# Altium schematic sheet Peripheral Connections.SchDoc
size B; SheetNumber: 4; SheetTotal: 5
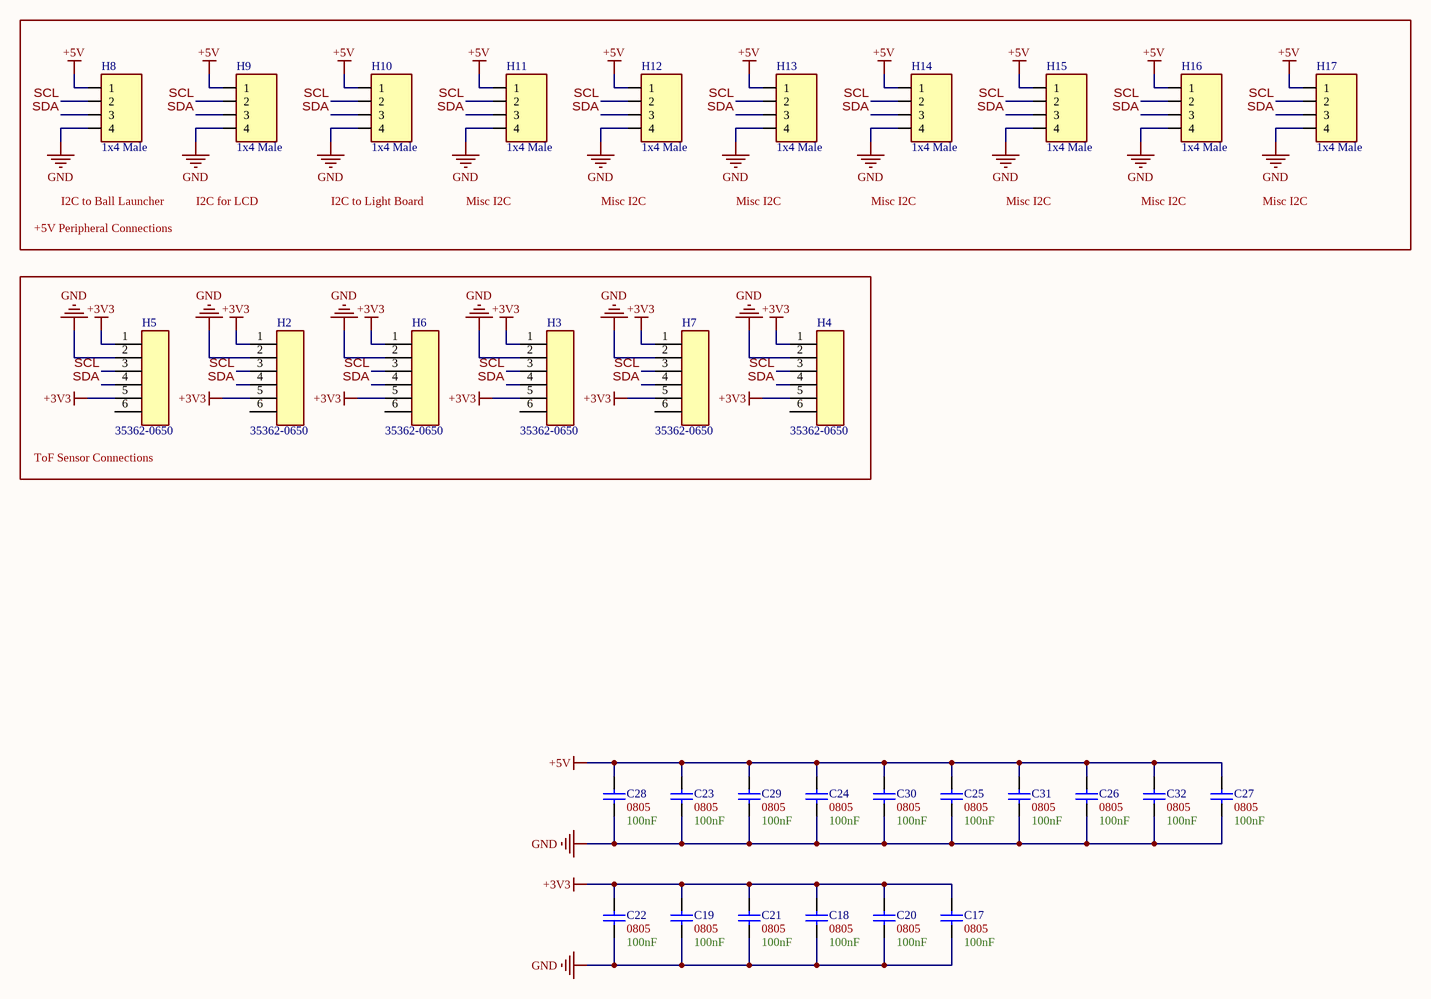
[diagram p0: Peripheral Connections.SchDoc]

## Parts
C17  Size Package: 0805  Capacitance: 100nF  [[Cap] SMD 0805]  (hidden comment: SMD Nonpolarized)
C18  Size Package: 0805  Capacitance: 100nF  [[Cap] SMD 0805]  (hidden comment: SMD Nonpolarized)
C19  Size Package: 0805  Capacitance: 100nF  [[Cap] SMD 0805]  (hidden comment: SMD Nonpolarized)
C20  Size Package: 0805  Capacitance: 100nF  [[Cap] SMD 0805]  (hidden comment: SMD Nonpolarized)
C21  Size Package: 0805  Capacitance: 100nF  [[Cap] SMD 0805]  (hidden comment: SMD Nonpolarized)
C22  Size Package: 0805  Capacitance: 100nF  [[Cap] SMD 0805]  (hidden comment: SMD Nonpolarized)
C23  Size Package: 0805  Capacitance: 100nF  [[Cap] SMD 0805]  (hidden comment: SMD Nonpolarized)
C24  Size Package: 0805  Capacitance: 100nF  [[Cap] SMD 0805]  (hidden comment: SMD Nonpolarized)
C25  Size Package: 0805  Capacitance: 100nF  [[Cap] SMD 0805]  (hidden comment: SMD Nonpolarized)
C26  Size Package: 0805  Capacitance: 100nF  [[Cap] SMD 0805]  (hidden comment: SMD Nonpolarized)
C27  Size Package: 0805  Capacitance: 100nF  [[Cap] SMD 0805]  (hidden comment: SMD Nonpolarized)
C28  Size Package: 0805  Capacitance: 100nF  [[Cap] SMD 0805]  (hidden comment: SMD Nonpolarized)
C29  Size Package: 0805  Capacitance: 100nF  [[Cap] SMD 0805]  (hidden comment: SMD Nonpolarized)
C30  Size Package: 0805  Capacitance: 100nF  [[Cap] SMD 0805]  (hidden comment: SMD Nonpolarized)
C31  Size Package: 0805  Capacitance: 100nF  [[Cap] SMD 0805]  (hidden comment: SMD Nonpolarized)
C32  Size Package: 0805  Capacitance: 100nF  [[Cap] SMD 0805]  (hidden comment: SMD Nonpolarized)
H2  35362-0650  [[Sherlock] 6pin]
H3  35362-0650  [[Sherlock] 6pin]
H4  35362-0650  [[Sherlock] 6pin]
H5  35362-0650  [[Sherlock] 6pin]
H6  35362-0650  [[Sherlock] 6pin]
H7  35362-0650  [[Sherlock] 6pin]
H8  1x4 Male  [[Header] Shrouded 1x4 Male]
H9  1x4 Male  [[Header] Shrouded 1x4 Male]
H10  1x4 Male  [[Header] Shrouded 1x4 Male]
H11  1x4 Male  [[Header] Shrouded 1x4 Male]
H12  1x4 Male  [[Header] Shrouded 1x4 Male]
H13  1x4 Male  [[Header] Shrouded 1x4 Male]
H14  1x4 Male  [[Header] Shrouded 1x4 Male]
H15  1x4 Male  [[Header] Shrouded 1x4 Male]
H16  1x4 Male  [[Header] Shrouded 1x4 Male]
H17  1x4 Male  [[Header] Shrouded 1x4 Male]

## Blocks framed on the sheet
ToF Sensor Connections: H2-H7

## Nets
+3V3: C17.2 C18.2 C19.2 C20.2 C21.2 C22.2 H2.1 H2.5 H3.1 H3.5 H4.1 H4.5 H5.1 H5.5 H6.1 H6.5 H7.1 H7.5
+5V: C23.2 C24.2 C25.2 C26.2 C27.2 C28.2 C29.2 C30.2 C31.2 C32.2 H8.1 H9.1 H10.1 H11.1 H12.1 H13.1 H14.1 H15.1 H16.1 H17.1
GND: C17.1 C18.1 C19.1 C20.1 C21.1 C22.1 C23.1 C24.1 C25.1 C26.1 C27.1 C28.1 C29.1 C30.1 C31.1 C32.1 H2.2 H3.2 H4.2 H5.2 H6.2 H7.2 H8.4 H9.4 H10.4 H11.4 H12.4 H13.4 H14.4 H15.4 H16.4 H17.4
SCL: H2.3 H3.3 H4.3 H5.3 H6.3 H7.3 H8.2 H9.2 H10.2 H11.2 H12.2 H13.2 H14.2 H15.2 H16.2 H17.2
SDA: H2.4 H3.4 H4.4 H5.4 H6.4 H7.4 H8.3 H9.3 H10.3 H11.3 H12.3 H13.3 H14.3 H15.3 H16.3 H17.3

Not connected (* = marked no-connect by the designer): H2 6; H3 6; H4 6; H5 6; H6 6; H7 6

## Notes on the sheet
- +5V Peripheral Connections
- I2C to Ball Launcher
- I2C for LCD
- I2C to Light Board
- Misc I2C

## Library data of the parts
C17-C32 = [Cap] SMD Nonpolarized
H2-H7 = [Sherlock] 6pin: 2.00mm pitch
H8-H16 = [Header] Shrouded 1x4 Male: 70543-0003 / Mates with 0050579404
H17 = [Header] Shrouded 1x4 Male: 70543-0003 / Mates with 005057-9404; Supplier 1: Avnet; Supplier Part Number 1: 0705430003